# Altium schematic sheet ADC_Section.SchDoc
size A4; DocumentNumber: 6; SheetNumber: 6; SheetTotal: 11
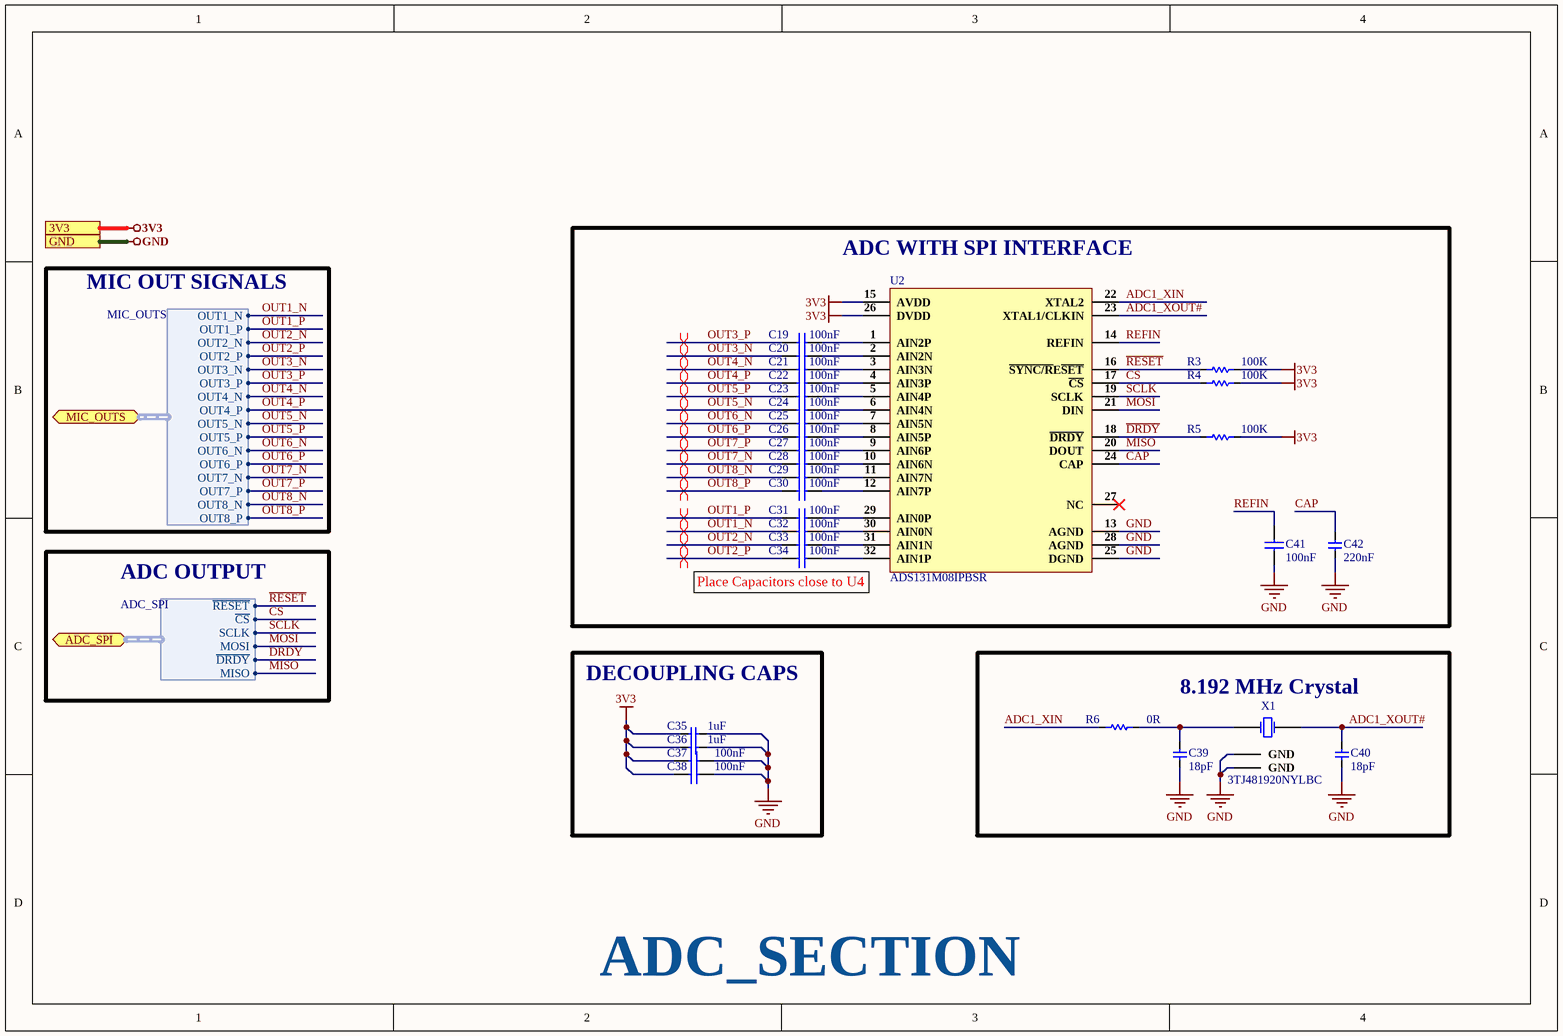
[diagram p0: ADC_Section.SchDoc]

## Parts
C19  100nF  [Cap-0402]
C20  100nF  [Cap-0402]
C21  100nF  [Cap-0402]
C22  100nF  [Cap-0402]
C23  100nF  [Cap-0402]
C24  100nF  [Cap-0402]
C25  100nF  [Cap-0402]
C26  100nF  [Cap-0402]
C27  100nF  [Cap-0402]
C28  100nF  [Cap-0402]
C29  100nF  [Cap-0402]
C30  100nF  [Cap-0402]
C31  100nF  [Cap-0402]
C32  100nF  [Cap-0402]
C33  100nF  [Cap-0402]
C34  100nF  [Cap-0402]
C35  1uF  [Cap-0603]
C36  1uF  [Cap-0603]
C37  100nF  [Cap-0603]
C38  100nF  [Cap-0603]
C39  18pF  [Cap-0603]
C40  18pF  [Cap-0603]
C41  100nF  [Cap-0603]
C42  220nF  [Cap-0805]
R3  100K  [RES-0603]
R4  100K  [RES-0603]
R5  100K  [RES-0603]
R6  0R  [Res-0603]
U2  ADS131M08IPBSR  [32TQFP]
X1  3TJ481920NYLBC  [3TJ481920NYLBC]

## Blocks framed on the sheet
ADC WITH SPI INTERFACE: C19-C34 C41 C42 R3-R5 U2
DECOUPLING CAPS: C35-C38
8.192 MHz Crystal: C39 C40 R6 X1

## Ports
3V3, ADC_SPI (bidir, harness ADC_SPI), GND, MIC_OUTS (bidir, harness MIC_OUTS)

## Harnesses
MIC_OUTS: OUT1_N, OUT1_P, OUT2_N, OUT2_P, OUT3_N, OUT3_P, OUT4_N, OUT4_P, OUT5_N, OUT5_P, OUT6_N, OUT6_P, OUT7_N, OUT7_P, OUT8_N, OUT8_P
ADC_SPI: ~{RESET}, ~{CS}, SCLK, MOSI, ~{DRDY}, MISO

## Nets
3V3: C35.1 C36.1 C37.1 C38.1 R3.2 R4.2 R5.2 U2.15(AVDD) U2.26(DVDD) ; port 3V3
GND: C35.2 C36.2 C37.2 C38.2 C39.1 C40.1 C41.2 C42.1 U2.13(AGND) U2.25(DGND) U2.28(AGND) X1.2(GND) X1.4(GND) ; port GND
~{CS}: R4.1 U2.17(~{CS}) ; port ADC_SPI.~{CS}
~{DRDY}: R5.1 U2.18(~{DRDY}) ; port ADC_SPI.~{DRDY}
~{RESET}: R3.1 U2.16(~{SYNC/R}E~{SET}) ; port ADC_SPI.~{RESET}
ADC1_XIN: R6.1 U2.22(XTAL2)
ADC1_XOUT#: C40.2 U2.23(XTAL1/CLKIN) X1.3(OSC2)
CAP: C42.2 U2.24(CAP)
MISO: U2.20(DOUT) ; port ADC_SPI.MISO
MOSI: U2.21(DIN) ; port ADC_SPI.MOSI
OUT1_N: C32.1 ; port MIC_OUTS.OUT1_N
OUT1_P: C31.1 ; port MIC_OUTS.OUT1_P
OUT2_N: C33.1 ; port MIC_OUTS.OUT2_N
OUT2_P: C34.1 ; port MIC_OUTS.OUT2_P
OUT3_N: C20.1 ; port MIC_OUTS.OUT3_N
OUT3_P: C19.1 ; port MIC_OUTS.OUT3_P
OUT4_N: C21.1 ; port MIC_OUTS.OUT4_N
OUT4_P: C22.1 ; port MIC_OUTS.OUT4_P
OUT5_N: C24.1 ; port MIC_OUTS.OUT5_N
OUT5_P: C23.1 ; port MIC_OUTS.OUT5_P
OUT6_N: C25.1 ; port MIC_OUTS.OUT6_N
OUT6_P: C26.1 ; port MIC_OUTS.OUT6_P
OUT7_N: C28.1 ; port MIC_OUTS.OUT7_N
OUT7_P: C27.1 ; port MIC_OUTS.OUT7_P
OUT8_N: C29.1 ; port MIC_OUTS.OUT8_N
OUT8_P: C30.1 ; port MIC_OUTS.OUT8_P
REFIN: C41.1 U2.14(REFIN)
SCLK: U2.19(SCLK) ; port ADC_SPI.SCLK
NetC19_2: C19.2 U2.1(AIN2P)
NetC20_2: C20.2 U2.2(AIN2N)
NetC21_2: C21.2 U2.3(AIN3N)
NetC22_2: C22.2 U2.4(AIN3P)
NetC23_2: C23.2 U2.5(AIN4P)
NetC24_2: C24.2 U2.6(AIN4N)
NetC25_2: C25.2 U2.7(AIN5N)
NetC26_2: C26.2 U2.8(AIN5P)
NetC27_2: C27.2 U2.9(AIN6P)
NetC28_2: C28.2 U2.10(AIN6N)
NetC29_2: C29.2 U2.11(AIN7N)
NetC30_2: C30.2 U2.12(AIN7P)
NetC31_2: C31.2 U2.29(AIN0P)
NetC32_2: C32.2 U2.30(AIN0N)
NetC33_2: C33.2 U2.31(AIN1N)
NetC34_2: C34.2 U2.32(AIN1P)
NetC39_2: C39.2 R6.2 X1.1(OSC1)

Not connected (* = marked no-connect by the designer): U2 27(NC)*

## Layout directives
differential pair; differential pair class OUT1_Lines; net class OUT1; rule Impedance Constraint [Min = 85.00    Max = 95.00    ]; rule Matched Net Lengths [Tolerance = 20mil]: OUT1_P
differential pair; differential pair class OUT1_Lines; net class OUT1; rule Matched Net Lengths [Tolerance = 20mil]; rule Impedance Constraint [Min = 85.00    Max = 95.00    ]: OUT1_N
differential pair; differential pair class OUT2_Lines; net class OUT2; rule Matched Net Lengths [Tolerance = 20mil]; rule Impedance Constraint [Min = 85.00    Max = 95.00    ]: OUT2_N, OUT2_P
differential pair; differential pair class OUT3_Lines; net class OUT3; rule Matched Net Lengths [Tolerance = 20mil]; rule Impedance Constraint [Min = 85.00    Max = 95.00    ]: OUT3_N, OUT3_P
differential pair; differential pair class OUT4_Lines; net class OUT4; rule Matched Net Lengths [Tolerance = 20mil]; rule Impedance Constraint [Min = 85.00    Max = 95.00    ]: OUT4_N, OUT4_P
differential pair; differential pair class OUT5_Lines; net class OUT5; rule Matched Net Lengths [Tolerance = 20mil]; rule Impedance Constraint [Min = 85.00    Max = 95.00    ]: OUT5_N, OUT5_P
differential pair; differential pair class OUT6_Lines; net class OUT6; rule Matched Net Lengths [Tolerance = 20mil]; rule Impedance Constraint [Min = 85.00    Max = 95.00    ]: OUT6_N, OUT6_P
differential pair; differential pair class OUT7_Lines; net class OUT7; rule Matched Net Lengths [Tolerance = 20mil]; rule Impedance Constraint [Min = 85.00    Max = 95.00    ]: OUT7_N, OUT7_P
differential pair; differential pair class OUT8_Lines; net class OUT8; rule Matched Net Lengths [Tolerance = 20mil]; rule Impedance Constraint [Min = 85.00    Max = 95.00    ]: OUT8_N, OUT8_P

## Notes on the sheet
- MIC OUT SIGNALS
- ADC OUTPUT
- (near C34) Place Capacitors close to U4
- ADC_SECTION
- File:
- Title:
- Date:
- Page
- Num:
- Total:
- Drawn By: Huzaifa Ali

## Library data of the parts
C19-C34 = CC0402KRX5R7BB104: CAP CER 0.1UF 16V X5R 0402; Manufacturer: Yageo; Tolerance: 10%; Supplier 1: Mouser; Manufacturer Part Number: CC0402KRX5R7BB104; RoHS: Yes; Category: Ceramic Capacitors; Stock 1: 936792; Pricing 1: 1=0.10000, 10=0.02300, 50=0.02300, 100=0.01100, 1000=0.00600, 10000=0.00400 (USD); Mount: Surface Mount; Case/Package: 0402; Number of Pins: 2; Case Code (Metric): 1005; Case Code (Imperial): 0402; Min Operating Temperature: -55°C; Max Operating Temperature: 85°C; Capacitance: 100nF; Dielectric: X5R; Packaging: Tape and Reel; Voltage Rating: 16V; Package Quantity: 1; Voltage Rating (DC): 16V; Termination: SMD/SMT; Resistor Type: Ceramic; Series: CC; Construction: Flat; Length: 1mm; Width: 0.02inch; Height: 0.5mm; Thickness: 0.022inch; Depth: 0.5mm; Radiation Hardening: No; REACH SVHC: Unknown; Lead Free: Lead Free; Halogen Free: Halogen Free; RoHS Compliant: Yes; ComponentLink1URL: https://datasheet.ciiva.com/155/mlccorderingcode-155879.pdf?src-supplier=Digi-Key; ComponentLink1Description: https://datasheet.ciiva.com/155/mlccorderingcode-155879.pdf?src-supplier=Digi-Key; ComponentLink2URL: https://datasheet.ciiva.com/155/mlccorderingcode-155878.pdf?src-supplier=Digi-Key; ComponentLink2Description: https://datasheet.ciiva.com/155/mlccorderingcode-155878.pdf?src-supplier=Digi-Key; ComponentLink3URL: https://datasheet.ciiva.com/155/mlccorderingcode-155880.pdf?src-supplier=Digi-Key; ComponentLink3Description: https://datasheet.ciiva.com/155/mlccorderingcode-155880.pdf?src-supplier=Digi-Key; ComponentLink4URL: https://datasheet.ciiva.com/11464/upy-gphc-x5r-4v-to-50v-12-11464869.pdf?src-supplier=Avnet; ComponentLink4Description: https://datasheet.ciiva.com/11464/upy-gphc-x5r-4v-to-50v-12-11464869.pdf?src-supplier=Avnet; Supplier Part Number 1: 603-CC402KRX5R7BB104; LCSC Part Number: C106204
C35 C36 = CC0603KRX5R8BB105: CAP CER 1UF 25V X5R 0603; Manufacturer: Yageo; Tolerance: 10%; Item Type: Capacitor; Supplier 1: Digi-Key; Manufacturer Part Number: CC0603KRX5R8BB105; RoHS: Yes; Category: Ceramic Capacitors; Stock 1: 919939; Pricing 1: 1=0.12000, 10=0.08400, 50=0.04760, 100=0.03940, 500=0.02764, 1000=0.02288 (USD); Mount: Surface Mount; Case/Package: 0603; Number of Pins: 2; Case Code (Metric): 1608; Case Code (Imperial): 0603; Min Operating Temperature: -55°C; Max Operating Temperature: 85°C; Capacitance: 1uF; Dielectric: X5R; Package Quantity: 1; Voltage Rating: 25V; Packaging: Tape and Reel; Termination: SMD/SMT; Voltage Rating (DC): 25V; Series: CC; Construction: Flat; Length: 1.6mm; Width: 0.031inch; Height: 0.8mm; Thickness: 0.035inch; Depth: 0.8mm; Radiation Hardening: No; REACH SVHC: No SVHC; Lead Free: Lead Free; Halogen Free: Halogen Free; RoHS Compliant: Yes; ComponentLink1URL: https://datasheet.ciiva.com/176/mlccorderingcode-176785.pdf?src-supplier=Digi-Key; ComponentLink1Description: https://datasheet.ciiva.com/176/mlccorderingcode-176785.pdf?src-supplier=Digi-Key; ComponentLink2URL: https://datasheet.ciiva.com/176/mlccorderingcode-176786.pdf?src-supplier=Digi-Key; ComponentLink2Description: https://datasheet.ciiva.com/176/mlccorderingcode-176786.pdf?src-supplier=Digi-Key; ComponentLink3URL: https://datasheet.ciiva.com/176/mlccorderingcode-176787.pdf?src-supplier=Digi-Key; ComponentLink3Description: https://datasheet.ciiva.com/176/mlccorderingcode-176787.pdf?src-supplier=Digi-Key; ComponentLink4URL: https://datasheet.ciiva.com/17436/upy-gphc-x5r-4v-to-50v-12-17436952.pdf?src-supplier=Avnet+Europe; ComponentLink4Description: https://datasheet.ciiva.com/17436/upy-gphc-x5r-4v-to-50v-12-17436952.pdf?src-supplier=Avnet+Europe; ComponentLink5URL: https://datasheet.ciiva.com/7978/1525783-7978171.pdf?src-supplier=Element14; ComponentLink5Description: https://datasheet.ciiva.com/7978/1525783-7978171.pdf?src-supplier=Element14; ComponentLink6URL: https://datasheet.ciiva.com/11586/upy-gphc-x5r-4v-to-50v-12-11586318.pdf?src-supplier=Avnet; ComponentLink6Description: https://datasheet.ciiva.com/11586/upy-gphc-x5r-4v-to-50v-12-11586318.pdf?src-supplier=Avnet; Supplier Part Number 1: 311-1445-1-ND; LCSC Part Number: C14664
C37 C38 C41 = CC0603KRX5R9BB104: CAP CER 0.1UF 50V X5R 0603; Manufacturer: Yageo; Tolerance: 10%; Item Type: Capacitor; Supplier 1: Digi-Key; Manufacturer Part Number: CC0603KRX5R9BB104; RoHS: Yes; Category: Ceramic Capacitors; Stock 1: 152253; Pricing 1: 1=0.10000, 10=0.05200, 50=0.02820, 100=0.02310, 500=0.01648, 1000=0.01294 (USD); Mount: Surface Mount; Case/Package: 0603; Case Code (Imperial): 0603; Case Code (Metric): 1608; Weight: 7.1E-05oz; Min Operating Temperature: -55°C; Max Operating Temperature: 85°C; Capacitance: 100nF; Packaging: Tape and Reel; Voltage Rating: 50V; Dielectric: X5R; Termination: SMD/SMT; Voltage Rating (DC): 50V; Package Quantity: 4000; Length: 0.063inch; Width: 0.031inch; Thickness: 0.035inch; Lead Free: Lead Free; Halogen Free: Halogen Free; ComponentLink1URL: http://www.mouser.com/ds/2/447/Yageo_UPY-GP_NP0_16V-to-50V_9-358835.pdf?src-supplier=Mouser; ComponentLink1Description: http://www.mouser.com/ds/2/447/Yageo_UPY-GP_NP0_16V-to-50V_9-358835.pdf?src-supplier=Mouser; ComponentLink2URL: https://www.yageo.com/upload/media/product/productsearch/datasheet/mlcc/UPY-GPHC_X5R_4V-to-50V_26.pdf?src-supplier=Digi-Key; ComponentLink2Description: https://www.yageo.com/upload/media/product/productsearch/datasheet/mlcc/UPY-GPHC_X5R_4V-to-50V_26.pdf?src-supplier=Digi-Key; ComponentLink3URL: http://www.yageo.com/exep/pages/download/literatures/ProductSelectionGuide%202014_Final_2.pdf?src-supplier=Digi-Key; ComponentLink3Description: http://www.yageo.com/exep/pages/download/literatures/ProductSelectionGuide%202014_Final_2.pdf?src-supplier=Digi-Key; Supplier Part Number 1: 311-4046-1-ND; LCSC Part Number: C110022
C39 C40 = CC0603JRNPO9BN180: CAP CER 18PF 50V C0G/NPO 0603; Manufacturer: Yageo; Tolerance: 5%; Dielectric: C0G; Temperature Coefficient: 30ppm/°C; Insulation Resistance: 100GR; Supplier 1: Digi-Key; Manufacturer Part Number: CC0603JRNPO9BN180; RoHS: Yes; Category: Ceramic Capacitors; Stock 1: 936645; Pricing 1: 1=0.10000, 10=0.04000, 50=0.02200, 100=0.01790, 500=0.01282, 1000=0.01007 (USD); Mount: Surface Mount; Case/Package: 0603; Number of Pins: 2; Case Code (Metric): 1608; Case Code (Imperial): 0603; Min Operating Temperature: -55°C; Max Operating Temperature: 125°C; Capacitance: 18pF; Packaging: Tape and Reel; Voltage Rating: 50V; Voltage Rating (DC): 50V; Package Quantity: 1; Termination: SMD/SMT; Resistor Type: Ceramic; Series: CC; Length: 1.6mm; Width: 0.031inch; Height: 0.8mm; Thickness: 0.035inch; Depth: 0.8mm; Radiation Hardening: No; REACH SVHC: No SVHC; Lead Free: Lead Free; RoHS Compliant: Yes; ComponentLink1URL: https://datasheet.ciiva.com/144/mlccorderingcode-144638.pdf?src-supplier=Digi-Key; ComponentLink1Description: https://datasheet.ciiva.com/144/mlccorderingcode-144638.pdf?src-supplier=Digi-Key; ComponentLink2URL: https://datasheet.ciiva.com/144/mlccorderingcode-144637.pdf?src-supplier=Digi-Key; ComponentLink2Description: https://datasheet.ciiva.com/144/mlccorderingcode-144637.pdf?src-supplier=Digi-Key; ComponentLink3URL: https://datasheet.ciiva.com/144/mlccorderingcode-144639.pdf?src-supplier=Digi-Key; ComponentLink3Description: https://datasheet.ciiva.com/144/mlccorderingcode-144639.pdf?src-supplier=Digi-Key; ComponentLink4URL: https://datasheet.ciiva.com/28450/1443161-28450477.pdf?src-supplier=Element14; ComponentLink4Description: https://datasheet.ciiva.com/28450/1443161-28450477.pdf?src-supplier=Element14; ComponentLink5URL: https://datasheet.ciiva.com/46430/1835847-46430152.pdf?src-supplier=Element14; ComponentLink5Description: https://datasheet.ciiva.com/46430/1835847-46430152.pdf?src-supplier=Element14; ComponentLink6URL: https://datasheet.ciiva.com/5425/upy-gp-np0-16v-to-50v-8-5425439.pdf?src-supplier=Mouser; ComponentLink6Description: https://datasheet.ciiva.com/5425/upy-gp-np0-16v-to-50v-8-5425439.pdf?src-supplier=Mouser; ComponentLink7URL: https://datasheet.ciiva.com/8033/1734582-8033733.pdf?src-supplier=Element14; ComponentLink7Description: https://datasheet.ciiva.com/8033/1734582-8033733.pdf?src-supplier=Element14; ComponentLink8URL: https://datasheet.ciiva.com/11587/upy-gp-np0-16v-to-50v-8-11587323.pdf?src-supplier=Avnet; ComponentLink8Description: https://datasheet.ciiva.com/11587/upy-gp-np0-16v-to-50v-8-11587323.pdf?src-supplier=Avnet; Supplier Part Number 1: 311-1061-6-ND; LCSC Part Number: C107040
C42 = 08051C224K4T2A: CAP CER 0.22UF 100V X7R 0805; Manufacturer: Kyocera AVX; Tolerance: 10%; Item Type: Capacitor; Supplier 1: Digi-Key; Manufacturer Part Number: 08051C224K4T2A; RoHS: Yes; Category: Ceramic Capacitors; Stock 1: 151; Pricing 1: 1=0.27000, 10=0.18500, 50=0.12320, 100=0.10470, 500=0.07392, 1000=0.06468 (USD); Mount: Surface Mount; Case/Package: 0805; Contact Plating: Tin; Min Operating Temperature: -55°C; Max Operating Temperature: 125°C; Termination: Wraparound; Capacitance: 220nF; Dielectric: X7R; Voltage Rating (DC): 100V; Length: 2.01mm; RoHS Compliant: Yes; ComponentLink1URL: http://datasheets.avx.com/AutoMLCC.pdf?src-supplier=Avnet+Asia; ComponentLink1Description: http://datasheets.avx.com/AutoMLCC.pdf?src-supplier=Avnet+Asia; Supplier Part Number 1: 478-13049-1-ND; LCSC Part Number: C2176107
R3-R5 = CRGH0603J100K: RES SMD 100K OHM 5% 1/5W 0603; Manufacturer: TE Connectivity; Resistance: 100kR; Temperature Coefficient: 100ppm/°C; Power Rating: 200mW; Voltage Rating: 50V; Number of Resistors: 1; Item Type: Resistor; Supplier 1: Digi-Key; Manufacturer Part Number: CRGH0603J100K; Stock 1: 23277; Pricing 1: 1=0.1, 10=0.049, 100=0.02, 1000=0.00899, 2500=0.0078 (USD); Mount: Surface Mount; Case/Package: 0603; Case Code (Imperial): 0603; Case Code (Metric): 1608; Min Operating Temperature: -55°C; Max Operating Temperature: 125°C; Tolerance: 5%; Packaging: Tape and Reel; Resistor Type: Thick Film,Power resistor; Number of Terminations: 2; Series: CRGH; Termination: Solder; Voltage Rating (DC): 50V; Resistance Tolerance: 5%; Technology: THICK FILM; Length: 1.6mm; Width: 0.8mm; Height: 0.45mm; Depth: 0.8mm; RoHS Compliant: Yes; REACH SVHC: No SVHC; ELV: Compliant; ComponentLink1URL: http://www.farnell.com/datasheets/2007183.pdf?src-supplier=Element14; ComponentLink1Description: http://www.farnell.com/datasheets/2007183.pdf?src-supplier=Element14; Supplier Part Number 1: A126393DKR-ND; LCSC Part Number: C2074142
R6 = RC0603JR-070RL: RES 0 OHM JUMPER 1/10W 0603; Manufacturer: Yageo; Resistance: 0mR; Tolerance: 1%; Power Rating: 100mW; Voltage Rating (DC): 50V; Temperature Coefficient: 200ppm/°C; Resistance Tolerance: 5%; Item Type: Resistor; Supplier 1: Digi-Key; Manufacturer Part Number: RC0603JR-070RL; RoHS: Yes; Category: Chip SMD Resistors; Stock 1: 18081776; Pricing 1: 1=0.10000, 10=0.01700, 25=0.01240, 50=0.00960, 100=0.00700, 250=0.00536, 500=0.00430, 1000=0.00316 (USD); Case/Package: 0603; Number of Pins: 2; Contact Plating: Tin,Matte; Case Code (Imperial): 0603; Case Code (Metric): 1608; Size Code: 0603; Min Operating Temperature: -55°C; Max Operating Temperature: 155°C; Resistor Type: Thick Film; Packaging: Tape and Reel; Termination: SMD/SMT; Series: RC; Technology: THICK FILM; Package Quantity: 5000; Voltage Rating: 50V; Features: Moisture Resistant; Max Power Dissipation: 100mW; Number of Terminations: 2; Construction: Rectangular; Length: 1.6mm; Width: 0.8mm; Height: 0.45mm; Depth: 0.8mm; Radiation Hardening: No; Reach SVHC Compliant: No SVHC; Lead Free: Lead Free; RoHS Compliant: Yes; Military Standard: Not; Supplier Part Number 1: 311-0.0GRCT-ND; LCSC Part Number: C95177
U2 = ADS131M08IPBSR: IC ADC 24BIT SIGMA-DELTA 32TQFP; Manufacturer: Texas Instruments; Supplier 1: Mouser; Manufacturer Part Number: ADS131M08IPBSR; RoHS: Yes; Category: Analog to Digital Converters (ADCs); Pricing 1: 1=8.85000, 10=7.99000, 50=7.62000, 100=6.62000, 1000=5.39000, 10000=5.39000 (USD); Supplier Part Number 1: 595-ADS131M08IPBSR
X1 = 3TJ481920NYLBC: 8.192MHz SMD Crystal Resonator 12pF 150Ω ±10ppm ±30ppm -40℃~+85℃ SMD_3225_4P Crystals ROHS; Manufacturer: JYJE; Manufacturer Part No: 3TJ481920NYLBC; Package: Custom